# Altium project Sound_Sensor.PrjPcb (part 1 of 4)
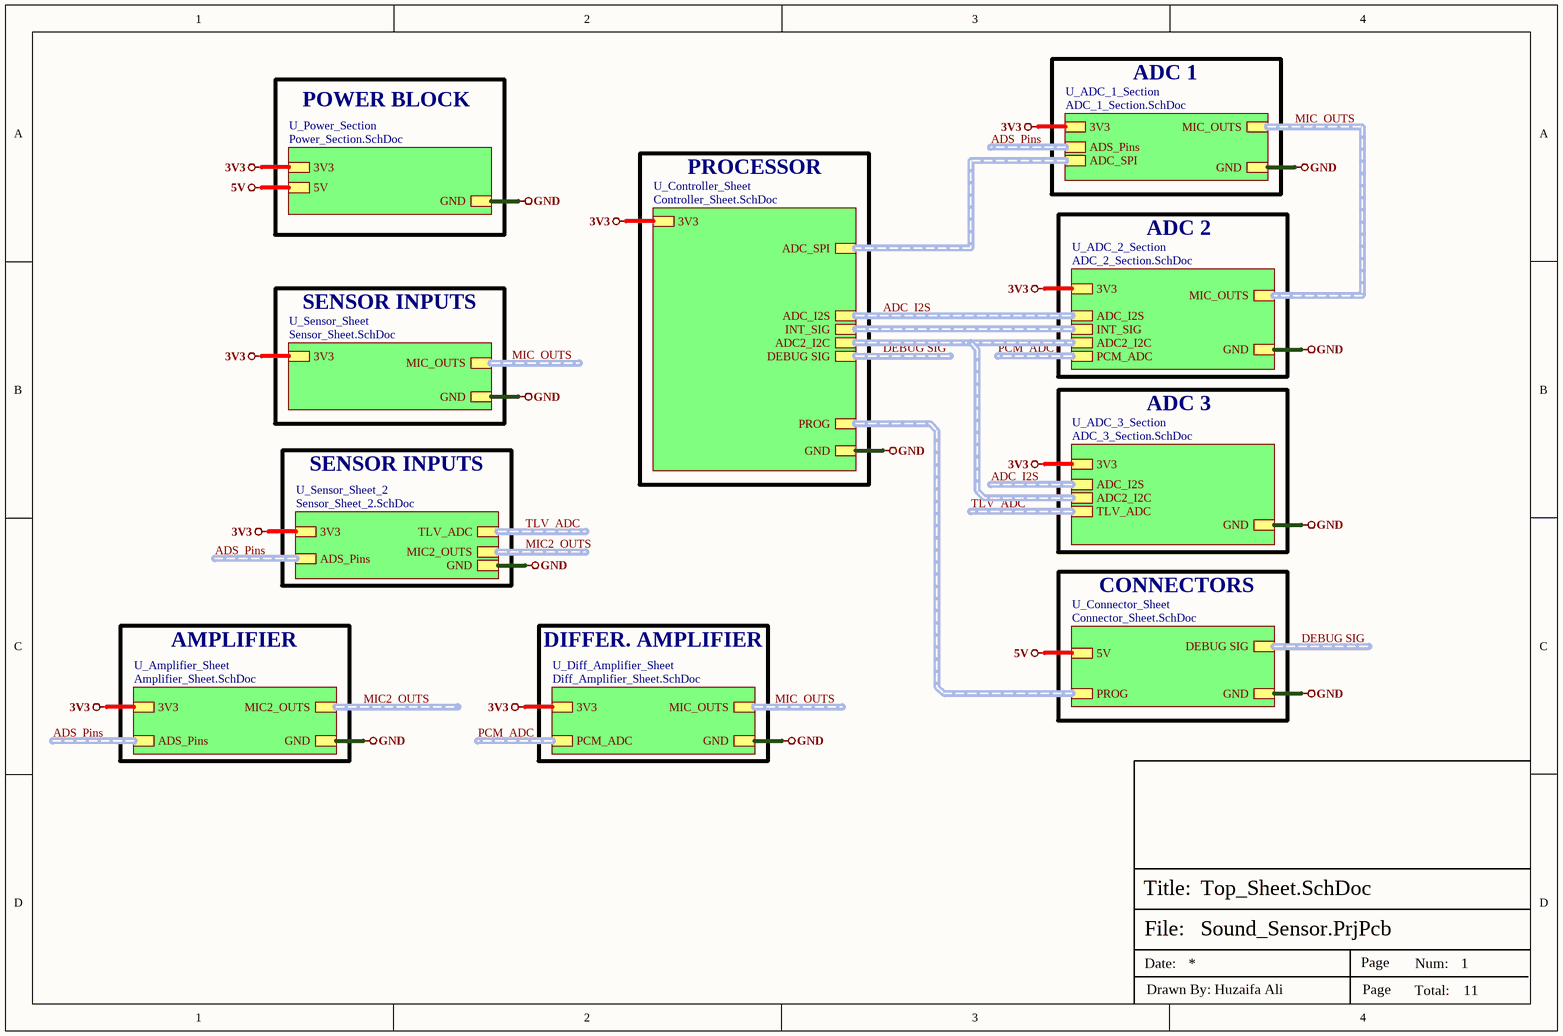
[diagram p0: Top_Sheet.SchDoc]
11 sheets, 369 parts. Net scope: hierarchical (ports join the sheet entries above them; power ports are global).
Board file: Sound_Sensor.PcbDoc
Sheets:
  Top_Sheet.SchDoc
    U_Sensor_Sheet = Sensor_Sheet.SchDoc
    U_Power_Section = Power_Section.SchDoc
    U_Controller_Sheet = Controller_Sheet.SchDoc
    U_Connector_Sheet = Connector_Sheet.SchDoc
    U_ADC_2_Section = ADC_2_Section.SchDoc
    U_ADC_3_Section = ADC_3_Section.SchDoc
    U_ADC_1_Section = ADC_1_Section.SchDoc
    U_Amplifier_Sheet = Amplifier_Sheet.SchDoc
    U_Sensor_Sheet_2 = Sensor_Sheet_2.SchDoc
    U_Diff_Amplifier_Sheet = Diff_Amplifier_Sheet.SchDoc

## Sheet Top_Sheet.SchDoc
size A4; DocumentNumber: 1; SheetNumber: 1; SheetTotal: 11

### Sub-sheets
U_ADC_1_Section = ADC_1_Section.SchDoc: MIC_OUTS (harness MIC_OUTS), ADC_SPI (harness ADC_SPI), 3V3, GND, ADS_Pins (harness ADS_Pins)
U_ADC_2_Section = ADC_2_Section.SchDoc: MIC_OUTS (harness MIC_OUTS), ADC_I2S (harness ADC_I2S), INT_SIG (harness INT_SIG), 3V3, GND, ADC2_I2C (harness ADC2_I2C), PCM_ADC (harness PCM_ADC)
U_ADC_3_Section = ADC_3_Section.SchDoc: 3V3, GND, ADC2_I2C (harness ADC2_I2C), ADC_I2S (harness ADC_I2S), TLV_ADC (harness TLV_ADC)
U_Amplifier_Sheet = Amplifier_Sheet.SchDoc: MIC2_OUTS (harness MIC2_OUTS), 3V3, GND, ADS_Pins (harness ADS_Pins)
U_Connector_Sheet = Connector_Sheet.SchDoc: PROG (harness PROG), GND, 5V, DEBUG SIG (harness DEBUG SIG)
U_Controller_Sheet = Controller_Sheet.SchDoc: PROG (harness PROG), ADC_SPI (harness ADC_SPI), INT_SIG (harness INT_SIG), ADC2_I2C (harness ADC2_I2C), 3V3, GND, ADC_I2S (harness ADC_I2S), DEBUG SIG (harness DEBUG SIG)
U_Diff_Amplifier_Sheet = Diff_Amplifier_Sheet.SchDoc: 3V3, GND, MIC_OUTS (harness MIC_OUTS), PCM_ADC (harness PCM_ADC)
U_Power_Section = Power_Section.SchDoc: 3V3, GND, 5V
U_Sensor_Sheet = Sensor_Sheet.SchDoc: MIC_OUTS (harness MIC_OUTS), 3V3, GND
U_Sensor_Sheet_2 = Sensor_Sheet_2.SchDoc: 3V3, GND, ADS_Pins (harness ADS_Pins), TLV_ADC (harness TLV_ADC), MIC2_OUTS (harness MIC2_OUTS)

### Nets
3V3: sheet U_Sensor_Sheet/3V3, sheet U_Power_Section/3V3, sheet U_Controller_Sheet/3V3, sheet U_ADC_2_Section/3V3, sheet U_ADC_3_Section/3V3, sheet U_ADC_1_Section/3V3, sheet U_Amplifier_Sheet/3V3, sheet U_Sensor_Sheet_2/3V3, sheet U_Diff_Amplifier_Sheet/3V3
5V: sheet U_Power_Section/5V, sheet U_Connector_Sheet/5V
GND: sheet U_Sensor_Sheet/GND, sheet U_Power_Section/GND, sheet U_Controller_Sheet/GND, sheet U_Connector_Sheet/GND, sheet U_ADC_2_Section/GND, sheet U_ADC_3_Section/GND, sheet U_ADC_1_Section/GND, sheet U_Amplifier_Sheet/GND, sheet U_Sensor_Sheet_2/GND, sheet U_Diff_Amplifier_Sheet/GND

### Buses and harness runs
harness ADC_I2S = sheet U_ADC_2_Section/ADC_I2S = sheet U_Controller_Sheet/ADC_I2S
harness ADC_I2S = sheet U_ADC_3_Section/ADC_I2S
harness ADS_Pins = sheet U_ADC_1_Section/ADS_Pins
harness ADS_Pins = sheet U_Amplifier_Sheet/ADS_Pins
harness ADS_Pins = sheet U_Sensor_Sheet_2/ADS_Pins
harness DEBUG SIG = sheet U_Connector_Sheet/DEBUG SIG
harness DEBUG SIG = sheet U_Controller_Sheet/DEBUG SIG
harness MIC2_OUTS = sheet U_Amplifier_Sheet/MIC2_OUTS
harness MIC2_OUTS = sheet U_Sensor_Sheet_2/MIC2_OUTS
harness MIC_OUTS = sheet U_ADC_1_Section/MIC_OUTS = sheet U_ADC_2_Section/MIC_OUTS
harness MIC_OUTS = sheet U_Diff_Amplifier_Sheet/MIC_OUTS
harness MIC_OUTS = sheet U_Sensor_Sheet/MIC_OUTS
harness PCM_ADC = sheet U_ADC_2_Section/PCM_ADC
harness PCM_ADC = sheet U_Diff_Amplifier_Sheet/PCM_ADC
harness sheet U_ADC_1_Section/ADC_SPI = sheet U_Controller_Sheet/ADC_SPI
harness sheet U_ADC_2_Section/ADC2_I2C = sheet U_ADC_3_Section/ADC2_I2C = sheet U_Controller_Sheet/ADC2_I2C
harness sheet U_ADC_2_Section/INT_SIG = sheet U_Controller_Sheet/INT_SIG
harness sheet U_Connector_Sheet/PROG = sheet U_Controller_Sheet/PROG
harness TLV_ADC = sheet U_ADC_3_Section/TLV_ADC
harness TLV_ADC = sheet U_Sensor_Sheet_2/TLV_ADC

### Notes on the sheet
- POWER BLOCK
- ADC 1
- PROCESSOR
- ADC 2
- SENSOR INPUTS
- ADC 3
- AMPLIFIER
- DIFFER. AMPLIFIER
- CONNECTORS
- File:
- Title:
- Date:
- Page
- Num:
- Total:
- Drawn By: Huzaifa Ali

## Sheet Sensor_Sheet.SchDoc
size A4; DocumentNumber: 3; SheetNumber: 3; SheetTotal: 11
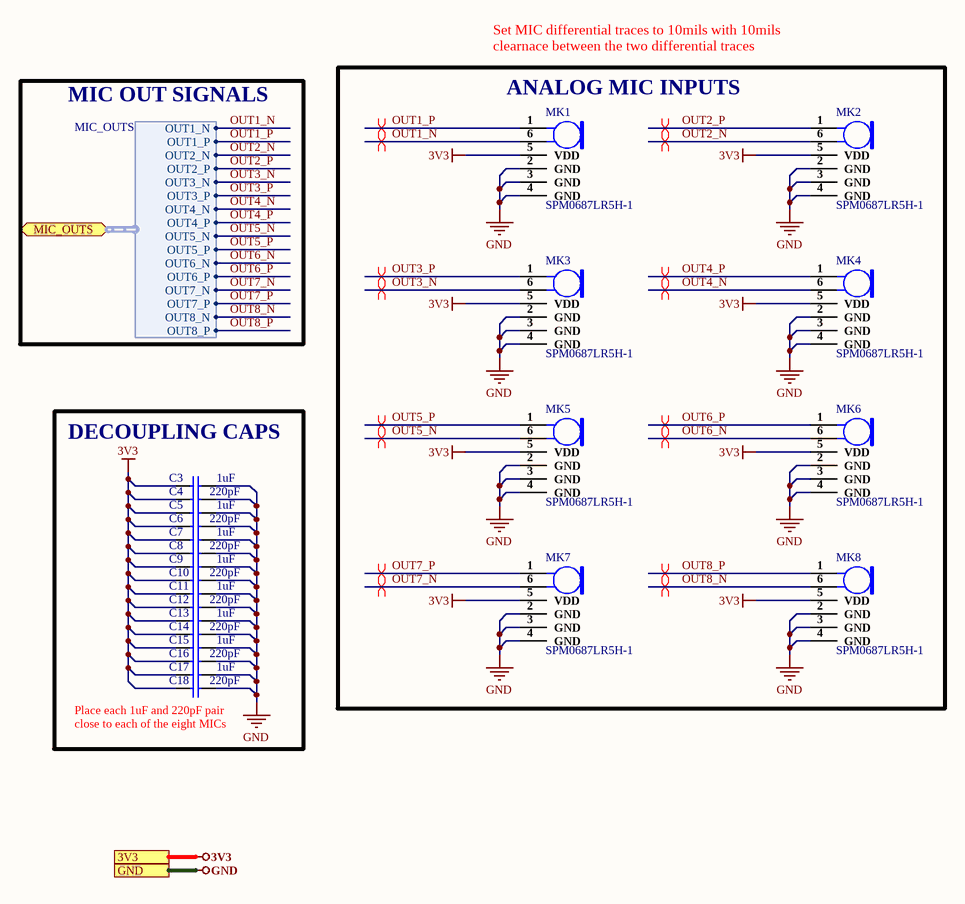
[diagram p1: Sensor_Sheet.SchDoc]

### Parts
C3  1uF  [Cap-0402]
C4  220pF  [Cap 0402]
C5  1uF  [Cap-0402]
C6  220pF  [Cap 0402]
C7  1uF  [Cap-0402]
C8  220pF  [Cap 0402]
C9  1uF  [Cap-0402]
C10  220pF  [Cap 0402]
C11  1uF  [Cap-0402]
C12  220pF  [Cap 0402]
C13  1uF  [Cap-0402]
C14  220pF  [Cap 0402]
C15  1uF  [Cap-0402]
C16  220pF  [Cap 0402]
C17  1uF  [Cap-0402]
C18  220pF  [Cap 0402]
MK1  SPM0687LR5H-1  [SPM0687LR5H-1]
MK2  SPM0687LR5H-1  [SPM0687LR5H-1]
MK3  SPM0687LR5H-1  [SPM0687LR5H-1]
MK4  SPM0687LR5H-1  [SPM0687LR5H-1]
MK5  SPM0687LR5H-1  [SPM0687LR5H-1]
MK6  SPM0687LR5H-1  [SPM0687LR5H-1]
MK7  SPM0687LR5H-1  [SPM0687LR5H-1]
MK8  SPM0687LR5H-1  [SPM0687LR5H-1]

### Blocks framed on the sheet
ANALOG MIC INPUTS: MK1-MK8
DECOUPLING CAPS: C3-C18

### Ports
3V3, GND, MIC_OUTS (bidir, harness MIC_OUTS)

### Harnesses
MIC_OUTS: OUT1_N, OUT1_P, OUT2_N, OUT2_P, OUT3_N, OUT3_P, OUT4_N, OUT4_P, OUT5_N, OUT5_P, OUT6_N, OUT6_P, OUT7_N, OUT7_P, OUT8_N, OUT8_P

### Nets
3V3: C3.1 C4.1 C5.1 C6.1 C7.1 C8.1 C9.1 C10.1 C11.1 C12.1 C13.1 C14.1 C15.1 C16.1 C17.1 C18.1 MK1.5(VDD) MK2.5(VDD) MK3.5(VDD) MK4.5(VDD) MK5.5(VDD) MK6.5(VDD) MK7.5(VDD) MK8.5(VDD) ; port 3V3
GND: C3.2 C4.2 C5.2 C6.2 C7.2 C8.2 C9.2 C10.2 C11.2 C12.2 C13.2 C14.2 C15.2 C16.2 C17.2 C18.2 MK1.2(GND) MK1.3(GND) MK1.4(GND) MK2.2(GND) MK2.3(GND) MK2.4(GND) MK3.2(GND) MK3.3(GND) MK3.4(GND) MK4.2(GND) MK4.3(GND) MK4.4(GND) MK5.2(GND) MK5.3(GND) MK5.4(GND) MK6.2(GND) MK6.3(GND) MK6.4(GND) MK7.2(GND) MK7.3(GND) MK7.4(GND) MK8.2(GND) MK8.3(GND) MK8.4(GND) ; port GND
OUT1_N: MK1.6(OUT-) ; port MIC_OUTS.OUT1_N  [project net MIC_OUTS.OUT1_N]
OUT1_P: MK1.1(OUT+) ; port MIC_OUTS.OUT1_P  [project net MIC_OUTS.OUT1_P]
OUT2_N: MK2.6(OUT-) ; port MIC_OUTS.OUT2_N  [project net MIC_OUTS.OUT2_N]
OUT2_P: MK2.1(OUT+) ; port MIC_OUTS.OUT2_P  [project net MIC_OUTS.OUT2_P]
OUT3_N: MK3.6(OUT-) ; port MIC_OUTS.OUT3_N  [project net MIC_OUTS.OUT3_N]
OUT3_P: MK3.1(OUT+) ; port MIC_OUTS.OUT3_P  [project net MIC_OUTS.OUT3_P]
OUT4_N: MK4.6(OUT-) ; port MIC_OUTS.OUT4_N  [project net MIC_OUTS.OUT4_N]
OUT4_P: MK4.1(OUT+) ; port MIC_OUTS.OUT4_P  [project net MIC_OUTS.OUT4_P]
OUT5_N: MK5.6(OUT-) ; port MIC_OUTS.OUT5_N  [project net MIC_OUTS.OUT5_N]
OUT5_P: MK5.1(OUT+) ; port MIC_OUTS.OUT5_P  [project net MIC_OUTS.OUT5_P]
OUT6_N: MK6.6(OUT-) ; port MIC_OUTS.OUT6_N  [project net MIC_OUTS.OUT6_N]
OUT6_P: MK6.1(OUT+) ; port MIC_OUTS.OUT6_P  [project net MIC_OUTS.OUT6_P]
OUT7_N: MK7.6(OUT-) ; port MIC_OUTS.OUT7_N  [project net MIC_OUTS.OUT7_N]
OUT7_P: MK7.1(OUT+) ; port MIC_OUTS.OUT7_P  [project net MIC_OUTS.OUT7_P]
OUT8_N: MK8.6(OUT-) ; port MIC_OUTS.OUT8_N  [project net MIC_OUTS.OUT8_N]
OUT8_P: MK8.1(OUT+) ; port MIC_OUTS.OUT8_P  [project net MIC_OUTS.OUT8_P]

### Layout directives
differential pair; net class OUT1; differential pair class OUT1_Lines: MIC_OUTS.OUT1_N, MIC_OUTS.OUT1_P
differential pair; net class OUT3; differential pair class OUT3_Lines: MIC_OUTS.OUT3_N, MIC_OUTS.OUT3_P
differential pair; net class OUT5; differential pair class OUT5_Lines: MIC_OUTS.OUT5_N, MIC_OUTS.OUT5_P
differential pair; net class OUT7; differential pair class OUT7_Lines: MIC_OUTS.OUT7_N, MIC_OUTS.OUT7_P
differential pair; net class OUT8; differential pair class OUT8_Lines: MIC_OUTS.OUT8_N, MIC_OUTS.OUT8_P
differential pair; net class OUT6; differential pair class OUT6_Lines: MIC_OUTS.OUT6_N, MIC_OUTS.OUT6_P
differential pair; net class OUT4; differential pair class OUT4_Lines: MIC_OUTS.OUT4_N, MIC_OUTS.OUT4_P
differential pair; net class OUT2; differential pair class OUT2_Lines: MIC_OUTS.OUT2_N, MIC_OUTS.OUT2_P

### Notes on the sheet
- Set MIC differential traces to 10mils with 10mils clearnace between the two differential traces
- MIC OUT SIGNALS
- (near C18) Place each 1uF and 220pF pair close to each of the eight MICs
- File:
- Title:
- Date:
- Page
- Num:
- Total:
- Drawn By: Huzaifa Ali

### Library data of the parts
C3 C5 C7 C9 C11 C13 C15 C17 = CC0402KRX5R8BB105: CAP CER 1UF 25V X5R 0402; Manufacturer: Yageo; Tolerance: 10%; Supplier 1: Mouser; Manufacturer Part Number: CC0402KRX5R8BB105; RoHS: Yes; Category: Ceramic Capacitors; Stock 1: 91975; Pricing 1: 1=0.30000, 10=0.20400, 50=0.20400, 100=0.11600, 1000=0.07200, 10000=0.05900 (USD); Mount: Surface Mount; Case/Package: 0402; Case Code (Metric): 1005; Case Code (Imperial): 0402; Weight: 2.3E-05oz; Min Operating Temperature: -55°C; Max Operating Temperature: 85°C; Packaging: Tape and Reel; Capacitance: 1uF; Voltage Rating: 25V; Dielectric: X5R; Termination: SMD/SMT; Voltage Rating (DC): 25V; Package Quantity: 10000; Length: 0.039inch; Width: 0.02inch; Thickness: 0.022inch; Lead Free: Lead Free; Halogen Free: Halogen Free; RoHS Compliant: Yes; ComponentLink1URL: http://www.mouser.com/ds/2/447/Yageo_UPY-GP_NP0_16V-to-50V_9-358835.pdf?src-supplier=Mouser; ComponentLink1Description: http://www.mouser.com/ds/2/447/Yageo_UPY-GP_NP0_16V-to-50V_9-358835.pdf?src-supplier=Mouser; ComponentLink2URL: http://www.yageo.com/documents/recent/UPY-GPHC_X5R_4V-to-50V_25.pdf?src-supplier=Digi-Key; ComponentLink2Description: http://www.yageo.com/documents/recent/UPY-GPHC_X5R_4V-to-50V_25.pdf?src-supplier=Digi-Key; ComponentLink3URL: https://4donline.ihs.com/images/VipMasterIC/IC/YAGO/YAGO-S-A0006851646/YAGO-S-A0006851646-1.pdf?hkey=6D3A4C79FDBF58556ACFDE234799DDF0&src-supplier=Newark; ComponentLink3Description: https://4donline.ihs.com/images/VipMasterIC/IC/YAGO/YAGO-S-A0006851646/YAGO-S-A0006851646-1.pdf?hkey=6D3A4C79FDBF58556ACFDE234799DDF0&src-supplier=Newark; Supplier Part Number 1: 603-CC402KRX5R8BB105; LCSC Part Number: C326568
C4 C6 C8 C10 C12 C14 C16 C18 = CC0402JRNPO9BN221: CAP CER 220PF 50V C0G/NPO 0402; Manufacturer: Yageo; Dielectric Material: Ceramic; Tolerance: 10%; Dielectric: C0G; Temperature Coefficient: 30ppm/°C; Insulation Resistance: 10GR; Dissipation Factor: 0.1%; Supplier 1: RSComponents; Manufacturer Part Number: CC0402JRNPO9BN221; RoHS: Yes; Category: Ceramic Capacitors; Stock 1: 20000; Pricing 1: 10000=0.00600, 100000=0.00600 (GBP); Mount: Surface Mount; Case/Package: 0402; Number of Pins: 2; Case Code (Metric): 1005; Case Code (Imperial): 0402; Min Operating Temperature: -55°C; Max Operating Temperature: 125°C; Capacitance: 220pF; Package Quantity: 1; Voltage Rating: 50V; Packaging: Tape and Reel; Termination: SMD/SMT; Voltage: 50V; Series: CC; Length: 1mm; Width: 0.02inch; Height: 0.5mm; Thickness: 0.022inch; Depth: 0.5mm; Radiation Hardening: No; RoHS Compliant: Yes; REACH SVHC: No SVHC; Lead Free: Lead Free; ComponentLink1URL: https://datasheet.ciiva.com/11786/0900766b8079c870-11786154.pdf?src-supplier=RSComponents; ComponentLink1Description: https://datasheet.ciiva.com/11786/0900766b8079c870-11786154.pdf?src-supplier=RSComponents; ComponentLink2URL: https://datasheet.ciiva.com/7656/1132289-7656616.pdf?src-supplier=Element14; ComponentLink2Description: https://datasheet.ciiva.com/7656/1132289-7656616.pdf?src-supplier=Element14; ComponentLink3URL: https://datasheet.ciiva.com/8033/1443161-8033609.pdf?src-supplier=Element14; ComponentLink3Description: https://datasheet.ciiva.com/8033/1443161-8033609.pdf?src-supplier=Element14; ComponentLink4URL: https://datasheet.ciiva.com/8033/1443161-8033608.pdf?src-supplier=Element14; ComponentLink4Description: https://datasheet.ciiva.com/8033/1443161-8033608.pdf?src-supplier=Element14; ComponentLink5URL: https://datasheet.ciiva.com/176/mlccorderingcode-176384.pdf?src-supplier=Digi-Key; ComponentLink5Description: https://datasheet.ciiva.com/176/mlccorderingcode-176384.pdf?src-supplier=Digi-Key; ComponentLink6URL: https://datasheet.ciiva.com/176/mlccorderingcode-176383.pdf?src-supplier=Digi-Key; ComponentLink6Description: https://datasheet.ciiva.com/176/mlccorderingcode-176383.pdf?src-supplier=Digi-Key; ComponentLink7URL: https://datasheet.ciiva.com/176/mlccorderingcode-176385.pdf?src-supplier=Digi-Key; ComponentLink7Description: https://datasheet.ciiva.com/176/mlccorderingcode-176385.pdf?src-supplier=Digi-Key; ComponentLink8URL: https://datasheet.ciiva.com/17434/upy-gp-np0-16v-to-50v-8-17434343.pdf?src-supplier=Avnet+Europe; ComponentLink8Description: https://datasheet.ciiva.com/17434/upy-gp-np0-16v-to-50v-8-17434343.pdf?src-supplier=Avnet+Europe; Supplier Part Number 1: 6169284
MK1-MK8 = SPM0687LR5H-1: WINFREY MIC HI SNR/AOP BOT PORT; Manufacturer: Knowles; Shape: Rectangular; Output Type: Analog; Operating Supply Current: 285uA; Item Type: Microphone; Supplier 1: Digi-Key; Manufacturer Part Number: SPM0687LR5H-1; RoHS: Yes; Category: Microphones; Stock 1: 116440; Pricing 1: 1=2.12000, 10=1.75900, 25=1.62560, 50=1.52880, 100=1.43540, 500=1.23212, 1000=1.17611 (USD); Packaging: Cut Tape; Termination: Solder; ComponentLink1URL: https://media.digikey.com/pdf/Data%20Sheets/Knowles%20Acoustics%20PDFs/SPM0687LR5H-1.pdf?src-supplier=Digi-Key; ComponentLink1Description: https://media.digikey.com/pdf/Data%20Sheets/Knowles%20Acoustics%20PDFs/SPM0687LR5H-1.pdf?src-supplier=Digi-Key; Supplier Part Number 1: 423-SPM0687LR5H-1CT-ND; LCSC Part Number: *

## Sheet Power_Section.SchDoc
size A4; DocumentNumber: 2; SheetNumber: 2; SheetTotal: 11
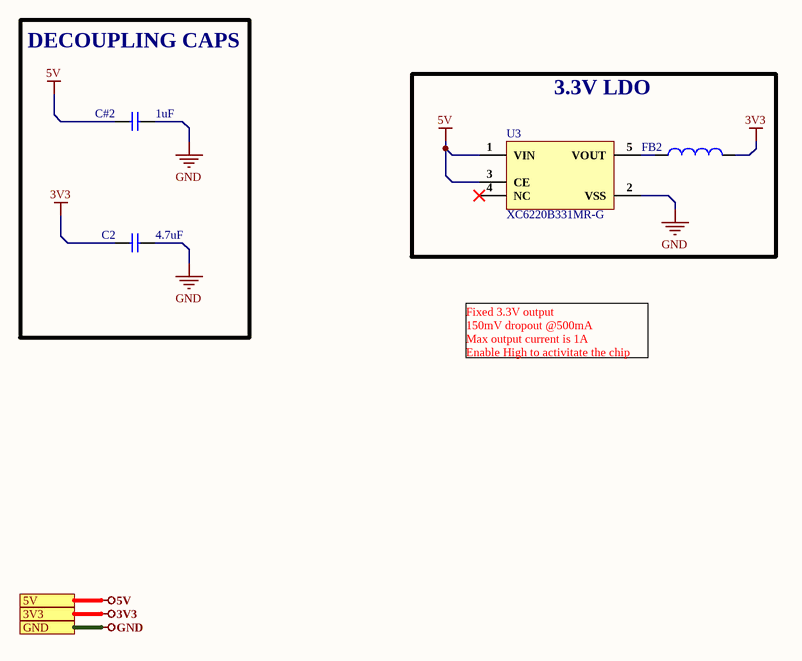
[diagram p2: Power_Section.SchDoc]

### Parts
C2  4.7uF  [Cap-0603]
C#2  1uF  [Cap-0402]
FB2  BLM18SG121TN1D  [IND-0603 (1608 Metric)]  (value not drawn)
U3  XC6220B331MR-G  [SOT-25]

### Blocks framed on the sheet
DECOUPLING CAPS: C2 C#2
3.3V LDO: FB2 U3

### Ports
3V3, 5V, GND

### Nets
3V3: C2.1 FB2.2 ; port 3V3
5V: C#2.1 U3.1(VIN) U3.3(CE) ; port 5V
GND: C2.2 C#2.2 U3.2(VSS) ; port GND
NetFB2_1: FB2.1 U3.5(VOUT)

Not connected (* = marked no-connect by the designer): U3 4(NC)*

### Notes on the sheet
- Fixed 3.3V output
  150mV dropout @500mA
  Max output current is 1A
  Enable High to activitate the chip
- File:
- Title:
- Date:
- Page
- Num:
- Total:
- Drawn By: Huzaifa Ali

### Library data of the parts
C2 = CC0603KRX5R7BB475: CAP CER 4.7UF 16V X5R 0603; Manufacturer: Yageo; Tolerance: 10%; Supplier 1: Digi-Key; Manufacturer Part Number: CC0603KRX5R7BB475; RoHS: Yes; Category: Ceramic Capacitors; Stock 1: 547703; Pricing 1: 1=0.20000, 10=0.13800, 50=0.08280, 100=0.06990, 500=0.04784, 1000=0.04233 (USD); Mount: Surface Mount; Case/Package: 0603; Case Code (Imperial): 0603; Case Code (Metric): 1608; Weight: 7.1E-05oz; Min Operating Temperature: -55°C; Max Operating Temperature: 85°C; Capacitance: 4.7uF; Voltage Rating: 16V; Voltage Rating (DC): 16V; Packaging: Tape and Reel; Dielectric: X5R; Termination: SMD/SMT; Resistor Type: Ceramic; Series: CC; Length: 1.6mm; Width: 0.8mm; Height: 0.8mm; Thickness: 0.037inch; Depth: 0.8mm; Lead Free: Lead Free; Halogen Free: Halogen Free; RoHS Compliant: Yes; ComponentLink1URL: http://www.mouser.com/ds/2/447/UPY-GPHC_X5R_4V-to-50V_25-1131599.pdf?src-supplier=Mouser; ComponentLink1Description: http://www.mouser.com/ds/2/447/UPY-GPHC_X5R_4V-to-50V_25-1131599.pdf?src-supplier=Mouser; ComponentLink2URL: http://www.yageo.com/documents/recent/UPY-GPHC_X5R_4V-to-50V_25.pdf?src-supplier=Digi-Key; ComponentLink2Description: http://www.yageo.com/documents/recent/UPY-GPHC_X5R_4V-to-50V_25.pdf?src-supplier=Digi-Key; Supplier Part Number 1: 311-1785-1-ND; LCSC Part Number: C277476
C#2 = CC0402KRX5R8BB105: as C3 on sheet Sensor_Sheet; Supplier 1: Mouser; Manufacturer Part Number: CC0402KRX5R8BB105; RoHS: Yes; Category: Ceramic Capacitors; Stock 1: 91975; Pricing 1: 1=0.30000, 10=0.20400, 50=0.20400, 100=0.11600, 1000=0.07200, 10000=0.05900 (USD); Mount: Surface Mount; Case/Package: 0402; Case Code (Metric): 1005; Case Code (Imperial): 0402; Weight: 2.3E-05oz; Min Operating Temperature: -55°C; Max Operating Temperature: 85°C; Packaging: Tape and Reel; Capacitance: 1uF; Voltage Rating: 25V; Dielectric: X5R; Termination: SMD/SMT; Voltage Rating (DC): 25V; Package Quantity: 10000; Length: 0.039inch; Width: 0.02inch; Thickness: 0.022inch; Lead Free: Lead Free; Halogen Free: Halogen Free; RoHS Compliant: Yes; ComponentLink1URL: http://www.mouser.com/ds/2/447/Yageo_UPY-GP_NP0_16V-to-50V_9-358835.pdf?src-supplier=Mouser; ComponentLink1Description: http://www.mouser.com/ds/2/447/Yageo_UPY-GP_NP0_16V-to-50V_9-358835.pdf?src-supplier=Mouser; ComponentLink2URL: http://www.yageo.com/documents/recent/UPY-GPHC_X5R_4V-to-50V_25.pdf?src-supplier=Digi-Key; ComponentLink2Description: http://www.yageo.com/documents/recent/UPY-GPHC_X5R_4V-to-50V_25.pdf?src-supplier=Digi-Key; ComponentLink3URL: https://4donline.ihs.com/images/VipMasterIC/IC/YAGO/YAGO-S-A0006851646/YAGO-S-A0006851646-1.pdf?hkey=6D3A4C79FDBF58556ACFDE234799DDF0&src-supplier=Newark; ComponentLink3Description: https://4donline.ihs.com/images/VipMasterIC/IC/YAGO/YAGO-S-A0006851646/YAGO-S-A0006851646-1.pdf?hkey=6D3A4C79FDBF58556ACFDE234799DDF0&src-supplier=Newark; Supplier Part Number 1: 603-CC402KRX5R8BB105; LCSC Part Number: C326568
FB2 = BLM18SG121TN1D: FERRITE BEAD 120 OHM 0603 1LN; Manufacturer: Murata; Material: Steel,Ferrite; Tolerance: 25%; Impedance: 120R; DC Resistance (DCR): 25mR; Max DC Current: 3A; Number of Lines: 1; Test Frequency: 100MHz; Shielding: Unshielded; Supplier 1: Arrow Electronics; Manufacturer Part Number: BLM18SG121TN1D; RoHS: Yes; Category: Ferrite Beads and Chips; Stock 1: 82612; Pricing 1: 1=0.12640, 10=0.08350, 25=0.07210, 100=0.05150, 250=0.04730, 500=0.04110, 1000=0.03420, 3000=0.03360, 6000=0.03320, 15000=0.03270, 30000=0.03200, 75000=0.03150 (USD); Case/Package: 0603; Number of Pins: 2; Core Material: Ferrite; Case Code (Metric): 1608; Case Code (Imperial): 0603; Min Operating Temperature: -55°C; Max Operating Temperature: 125°C; Package Quantity: 1; Max Current Rating: 3A; Packaging: Tape and Reel; Current Rating: 3A; Termination: SMD/SMT; Frequency: 100MHz; Number of Circuits: 1; Series: BLM18S; DC Resistance-Max: 25mR; Length: 1.6mm; Width: 0.8mm; Height: 0.8mm; Depth: 0.8mm; Reach SVHC Compliant: Yes; Lead Free: Lead Free; RoHS Compliant: Yes; ComponentLink1URL: https://datasheet.ciiva.com/1012/l0110s0100blm18s-1012624.pdf?src-supplier=Digi-Key; ComponentLink1Description: https://datasheet.ciiva.com/1012/l0110s0100blm18s-1012624.pdf?src-supplier=Digi-Key; ComponentLink2URL: https://datasheet.ciiva.com/11799/0900766b811b5866-11799181.pdf?src-supplier=RSComponents; ComponentLink2Description: https://datasheet.ciiva.com/11799/0900766b811b5866-11799181.pdf?src-supplier=RSComponents; ComponentLink3URL: https://datasheet.ciiva.com/18093/getdatasheetpartid-295885-18093249.pdf?src-supplier=Verical; ComponentLink3Description: https://datasheet.ciiva.com/18093/getdatasheetpartid-295885-18093249.pdf?src-supplier=Verical; ComponentLink4URL: https://datasheet.ciiva.com/41449/001171723-da-01-en-chip-drossel0603-120r-3000ma-1-6x0-8mm-41449353.pdf?src-supplier=Conrad; ComponentLink4Description: https://datasheet.ciiva.com/41449/001171723-da-01-en-chip-drossel0603-120r-3000ma-1-6x0-8mm-41449353.pdf?src-supplier=Conrad; ComponentLink5URL: https://datasheet.ciiva.com/41449/001172312-da-01-en-drossel-0603-120r-1-6x0-8mm-10000st-41449675.pdf?src-supplier=Conrad; ComponentLink5Description: https://datasheet.ciiva.com/41449/001172312-da-01-en-drossel-0603-120r-1-6x0-8mm-10000st-41449675.pdf?src-supplier=Conrad; ComponentLink6URL: https://datasheet.ciiva.com/8021/5151-8021511.pdf?src-supplier=Element14; ComponentLink6Description: https://datasheet.ciiva.com/8021/5151-8021511.pdf?src-supplier=Element14; ComponentLink7URL: https://datasheet.ciiva.com/8021/5151-8021512.pdf?src-supplier=Element14; ComponentLink7Description: https://datasheet.ciiva.com/8021/5151-8021512.pdf?src-supplier=Element14; ComponentLink8URL: https://datasheet.ciiva.com/14122/blm-series-eng-tds-14122906.pdf?src-supplier=Distrelec; ComponentLink8Description: https://datasheet.ciiva.com/14122/blm-series-eng-tds-14122906.pdf?src-supplier=Distrelec; ComponentLink9URL: https://datasheet.ciiva.com/1012/l0110s0100blm18s-1012623.pdf?src-supplier=Digi-Key; ComponentLink9Description: https://datasheet.ciiva.com/1012/l0110s0100blm18s-1012623.pdf?src-supplier=Digi-Key; ComponentLink10URL: https://datasheet.ciiva.com/1012/l0110s0100blm18s-1012625.pdf?src-supplier=Digi-Key; ComponentLink10Description: https://datasheet.ciiva.com/1012/l0110s0100blm18s-1012625.pdf?src-supplier=Digi-Key; ComponentLink11URL: https://datasheet.ciiva.com/16395/l0110s0100blm18s-16395498.pdf?src-supplier=Future+Electronics; ComponentLink11Description: https://datasheet.ciiva.com/16395/l0110s0100blm18s-16395498.pdf?src-supplier=Future+Electronics; Supplier Part Number 1: BLM18SG121TN1D; LCSC Part Number: C113030; Item Type: Ferrite Bead
U3 = XC6220B331MR-G: Linear Voltage Regulator IC Positive Fixed 1 Output 3.3V 1A SOT-25; Manufacturer: Torex; Dropout Voltage: 655mV; Min Input Voltage: 1.6V; Max Input Voltage: 6V; Number of Regulators: 1; Min Current Limit: 1.005A; Supplier 1: Newark; Manufacturer Part Number: XC6220B331MR-G; RoHS: Yes; Category: Voltage Regulators - Linear; Stock 1: 3078; Pricing 1: 1=1.20000, 10=1.08000, 100=0.83900, 500=0.69300, 1000=0.54800 (USD); Mount: Surface Mount; Case/Package: SOT-25; Number of Pins: 5; Min Operating Temperature: -40°C; Max Operating Temperature: 85°C; Package Quantity: 1; Packaging: Tape and Reel; Output Current: 1A; Output Voltage: 3.3V; Nominal Output Voltage: 3.3V; Output Type: Fixed; Series: -; REACH SVHC: No SVHC; RoHS Compliant: Yes; ComponentLink1URL: https://datasheet.ciiva.com/7992/610888-7992813.pdf?src-supplier=Element14; ComponentLink1Description: https://datasheet.ciiva.com/7992/610888-7992813.pdf?src-supplier=Element14; ComponentLink2URL: https://datasheet.ciiva.com/5755/610888-5755886.pdf?src-supplier=Farnell; ComponentLink2Description: https://datasheet.ciiva.com/5755/610888-5755886.pdf?src-supplier=Farnell; ComponentLink3URL: https://datasheet.ciiva.com/2040/xc6220-2040201.pdf?src-supplier=Digi-Key; ComponentLink3Description: https://datasheet.ciiva.com/2040/xc6220-2040201.pdf?src-supplier=Digi-Key; ComponentLink4URL: https://datasheet.ciiva.com/2040/xc6220-2040200.pdf?src-supplier=Digi-Key; ComponentLink4Description: https://datasheet.ciiva.com/2040/xc6220-2040200.pdf?src-supplier=Digi-Key; ComponentLink5URL: https://datasheet.ciiva.com/2040/xc6220-2040202.pdf?src-supplier=Digi-Key; ComponentLink5Description: https://datasheet.ciiva.com/2040/xc6220-2040202.pdf?src-supplier=Digi-Key; Supplier Part Number 1: 84R0738

## Sheet Controller_Sheet.SchDoc
size A4; DocumentNumber: 5; SheetNumber: 5; SheetTotal: 11
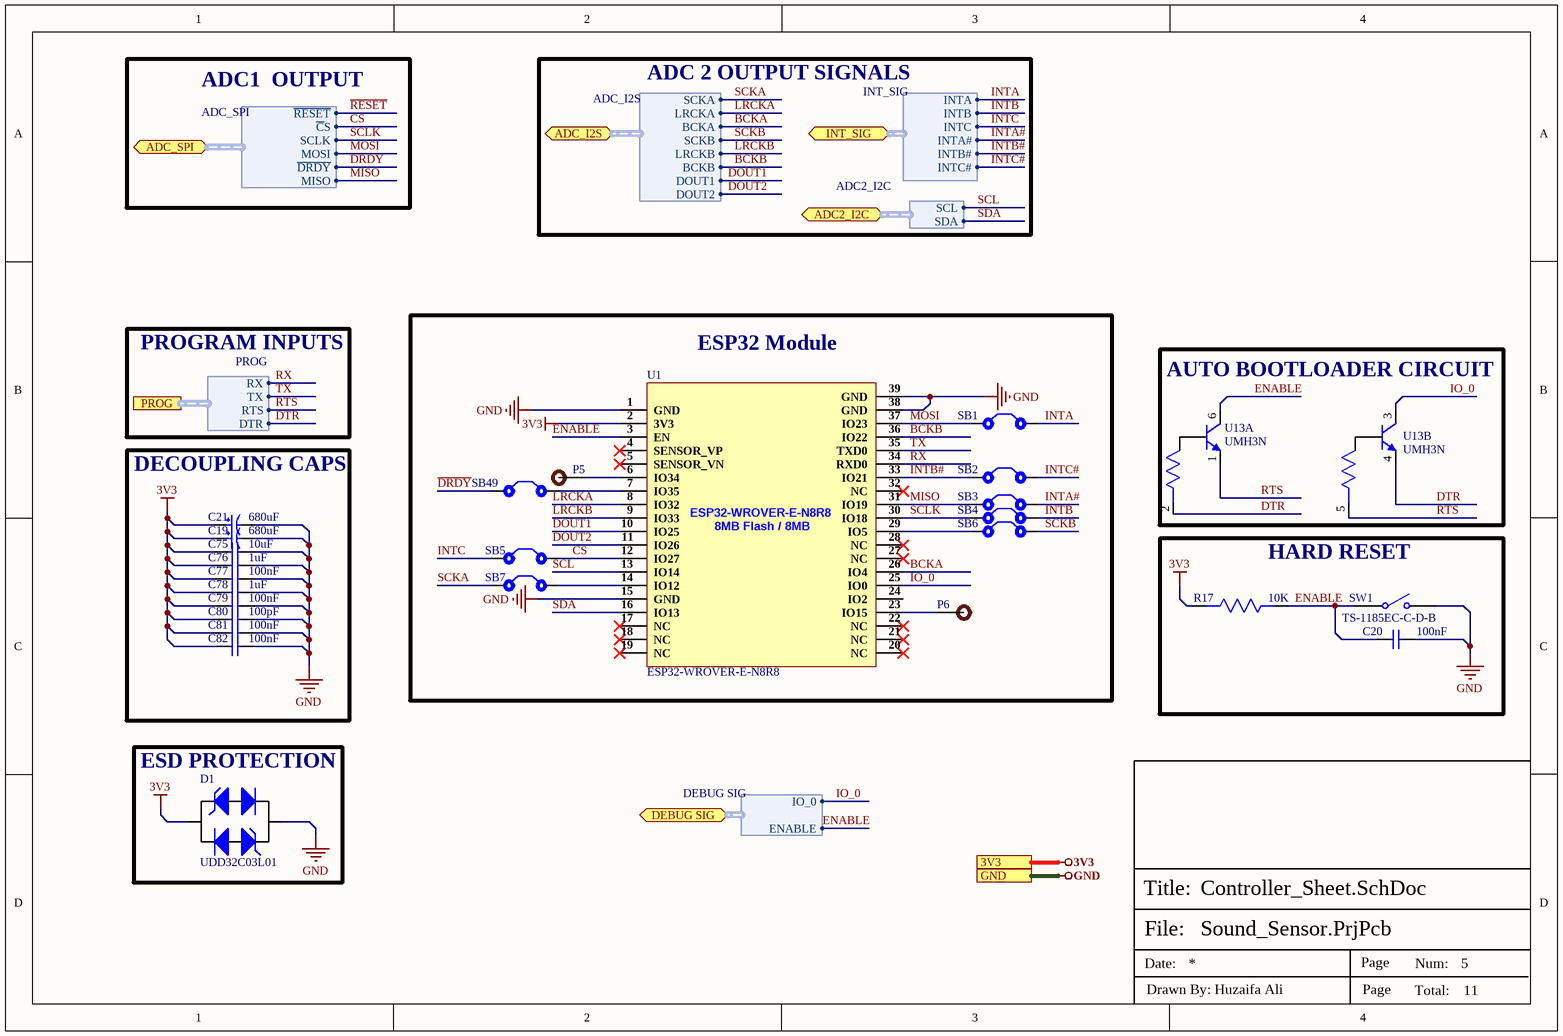
[diagram p3: Controller_Sheet.SchDoc]

### Parts
C19  680uF  [Case-D]
C20  100nF  [Cap-0603]
C21  680uF  [Case-D]
C75  10uF  [Cap-0603]
C76  1uF  [Cap-0402]
C77  100nF  [Cap-0603]
C78  1uF  [Cap-0402]
C79  100nF  [Cap-0603]
C80  100pF  [Cap 0603]
C81  100nF  [Cap-0603]
C82  100nF  [Cap-0603]
D1  UDD32C03L01  [UDD32C03L01]
P5  TEST POINT  [Test-point]  (value not drawn)
P6  TEST POINT  [Test-point]  (value not drawn)
R17  10K  [Res-0402]
SB1  Solder Bridge  [Solder Bridge]  (value not drawn)
SB2  Solder Bridge  [Solder Bridge]  (value not drawn)
SB3  Solder Bridge  [Solder Bridge]  (value not drawn)
SB4  Solder Bridge  [Solder Bridge]  (value not drawn)
SB5  Solder Bridge  [Solder Bridge]  (value not drawn)
SB6  Solder Bridge  [Solder Bridge]  (value not drawn)
SB7  Solder Bridge  [Solder Bridge]  (value not drawn)
SB49  Solder Bridge  [Solder Bridge]  (value not drawn)
SW1  TS-1185EC-C-D-B  [TS-1185EC-C-D-B]
U1  ESP32-WROVER-E-N8R8  [ESP32-WROVER-E-N8R8]
U13  UMH3N  [UMH3N]  (parts A,B of 2)

### Blocks framed on the sheet
ESP32 Module: P5 P6 SB1-SB7 SB49 U1
AUTO BOOTLOADER CIRCUIT: U13
DECOUPLING CAPS: C19 C21 C75-C82
HARD RESET: C20 R17 SW1
ESD PROTECTION: D1

### Ports
3V3, ADC2_I2C (bidir, harness ADC2_I2C), ADC_I2S (bidir, harness ADC_I2S), ADC_SPI (bidir, harness ADC_SPI), DEBUG SIG (bidir, harness DEBUG SIG), GND, INT_SIG (bidir, harness INT_SIG), PROG (harness PROG)

### Harnesses
PROG: RX, TX, RTS, DTR
ADC_SPI: ~{RESET}, ~{C}S, SCLK, MOSI, ~{DRDY}, MISO
INT_SIG: INTA, INTB, INTC, INTA#, INTB#, INTC#
ADC2_I2C: SCL, SDA
ADC_I2S: SCKA, LRCKA, BCKA, SCKB, LRCKB, BCKB, DOUT1, DOUT2
DEBUG SIG: IO_0, ENABLE

### Nets
3V3: C19.1 C21.1 C75.1 C76.1 C77.1 C78.1 C79.1 C80.1 C81.1 C82.1 D1.1 R17.2 U1.2(3V3) ; port 3V3
GND: C19.2 C20.2 C21.2 C75.2 C76.2 C77.2 C78.2 C79.2 C80.2 C81.2 C82.2 D1.2 SW1.2 U1.1(GND) U1.15(GND) U1.38(GND) U1.39(GND) ; port GND
~{C}S: SB5.2 U1.12(IO27) ; port ADC_SPI.~{C}S
~{DRDY}: SB49.1 ; port ADC_SPI.~{DRDY}
BCKA: U1.26(IO4) ; port ADC_I2S.BCKA  [project net ADC_I2S.BCKA]
BCKB: U1.36(IO22) ; port ADC_I2S.BCKB  [project net ADC_I2S.BCKB]
DOUT1: U1.10(IO25) ; port ADC_I2S.DOUT1  [project net ADC_I2S.DOUT1]
DOUT2: U1.11(IO26) ; port ADC_I2S.DOUT2  [project net ADC_I2S.DOUT2]
DTR: U13.2 U13.4(E) ; port PROG.DTR
ENABLE: C20.1 R17.1 SW1.1 U1.3(EN) U13.6(C) ; port DEBUG SIG.ENABLE  [project net DEBUG SIG.ENABLE]
INTA: SB1.2 ; port INT_SIG.INTA
INTA#: SB3.2 ; port INT_SIG.INTA#
INTB: SB4.2 ; port INT_SIG.INTB
INTB#: SB2.1 U1.33(IO21) ; port INT_SIG.INTB#
INTC: SB5.1 ; port INT_SIG.INTC
INTC#: SB2.2 ; port INT_SIG.INTC#
IO_0: U1.25(IO0) U13.3(C) ; port DEBUG SIG.IO_0  [project net DEBUG SIG.IO_0]
LRCKA: U1.8(IO32) ; port ADC_I2S.LRCKA  [project net ADC_I2S.LRCKA]
LRCKB: U1.9(IO33) ; port ADC_I2S.LRCKB  [project net ADC_I2S.LRCKB]
MISO: SB3.1 U1.31(IO19) ; port ADC_SPI.MISO
MOSI: SB1.1 U1.37(IO23) ; port ADC_SPI.MOSI
RTS: U13.1(E) U13.5 ; port PROG.RTS
RX: U1.34(RXD0) ; port PROG.RX
SCKA: SB7.1 ; port ADC_I2S.SCKA  [project net ADC_I2S.SCKA]
SCKB: SB6.2 ; port ADC_I2S.SCKB  [project net ADC_I2S.SCKB]
SCL: U1.13(IO14) ; port ADC2_I2C.SCL
SCLK: SB4.1 U1.30(IO18) ; port ADC_SPI.SCLK
SDA: U1.16(IO13) ; port ADC2_I2C.SDA
TX: U1.35(TXD0) ; port PROG.TX
NetP5_1: P5.1 U1.6(IO34)
NetP6_1: P6.1 U1.23(IO15)
NetSB6_1: SB6.1 U1.29(IO5)
NetSB7_2: SB7.2 U1.14(IO12)
NetSB49_2: SB49.2 U1.7(IO35)

Not connected (* = marked no-connect by the designer): U1 4(SENSOR_VP)* 5(SENSOR_VN)* 17(NC)* 18(NC)* 19(NC)* 20(NC)* 21(NC)* 22(NC)* 24(IO2) 27(NC)* 28(NC)* 32(NC)*

### Notes on the sheet
- ADC1  OUTPUT
- ADC 2 OUTPUT SIGNALS
- PROGRAM INPUTS
- File:
- Title:
- Date:
- Page
- Num:
- Total:
- Drawn By: Huzaifa Ali
- (in symbol ESP32-WROVER-E-N8R8) ESP32-WROVER-E-N8R8 / 8MB Flash / 8MB PSRAM

### Library data of the parts
C19 C21 = 6TPE680MI: CAP TANT POLY 680UF 6.3V 2917; Manufacturer: Panasonic; Tolerance: 20%; ESR (Equivalent Series Resistance): 18mR; Ripple Current: 3.5A; Leakage Current: 428.4uA; Polarity: Polar; Dissipation Factor: 15%; Item Type: Capacitor; Supplier 1: Digi-Key; Manufacturer Part Number: 6TPE680MI; RoHS: Yes; Category: Tantalum Capacitors; Stock 1: 9647; Pricing 1: 1=3.55000, 10=2.86700, 50=2.50240, 100=2.18960, 500=1.66828, 1000=1.45975 (USD); Mount: Surface Mount; Case/Package: 2917; Number of Pins: 4; Case Code (Metric): 7343; Case Code (Imperial): 2917; Min Operating Temperature: -55°C; Max Operating Temperature: 105°C; Packaging: Tape and Reel; Capacitance: 680uF; Package Quantity: 2000; Voltage Rating: 6.3V; Voltage Rating (DC): 6.3V; Termination: SMD/SMT; Voltage: 6.3V; Features: General Purpose; Series: POSCAP™ TPE; Construction: Flat; Length: 7.3mm; Width: 4.3mm; Height: 3.8mm; Height - Seated (Max): 0.157inch; Depth: 4.3mm; Radiation Hardening: No; Reach SVHC Compliant: Yes; Lead Free: Lead Free; RoHS Compliant: Yes; ComponentLink1URL: https://datasheet.ciiva.com/25786/1734363-25786077.pdf?src-supplier=Farnell; ComponentLink1Description: https://datasheet.ciiva.com/25786/1734363-25786077.pdf?src-supplier=Farnell; ComponentLink2URL: https://datasheet.ciiva.com/22745/1734363-22745373.pdf?src-supplier=Element14; ComponentLink2Description: https://datasheet.ciiva.com/22745/1734363-22745373.pdf?src-supplier=Element14; ComponentLink3URL: https://datasheet.ciiva.com/24022/tpe-os-262406-24022136.pdf?src-supplier=Mouser; ComponentLink3Description: https://datasheet.ciiva.com/24022/tpe-os-262406-24022136.pdf?src-supplier=Mouser; ComponentLink4URL: https://datasheet.ciiva.com/26840/getdatasheetpartid-750514-26840938.pdf?src-supplier=Verical; ComponentLink4Description: https://datasheet.ciiva.com/26840/getdatasheetpartid-750514-26840938.pdf?src-supplier=Verical; Supplier Part Number 1: P16633CT-ND; LCSC Part Number: C79115; ComponentLink5Description: New link; ComponentLink5URL: *
C20 C77 C79 C81 C82 = CC0603KRX5R9BB104: CAP CER 0.1UF 50V X5R 0603; Manufacturer: Yageo; Tolerance: 10%; Item Type: Capacitor; Supplier 1: Digi-Key; Manufacturer Part Number: CC0603KRX5R9BB104; RoHS: Yes; Category: Ceramic Capacitors; Stock 1: 152253; Pricing 1: 1=0.10000, 10=0.05200, 50=0.02820, 100=0.02310, 500=0.01648, 1000=0.01294 (USD); Mount: Surface Mount; Case/Package: 0603; Case Code (Imperial): 0603; Case Code (Metric): 1608; Weight: 7.1E-05oz; Min Operating Temperature: -55°C; Max Operating Temperature: 85°C; Capacitance: 100nF; Packaging: Tape and Reel; Voltage Rating: 50V; Dielectric: X5R; Termination: SMD/SMT; Voltage Rating (DC): 50V; Package Quantity: 4000; Length: 0.063inch; Width: 0.031inch; Thickness: 0.035inch; Lead Free: Lead Free; Halogen Free: Halogen Free; ComponentLink1URL: http://www.mouser.com/ds/2/447/Yageo_UPY-GP_NP0_16V-to-50V_9-358835.pdf?src-supplier=Mouser; ComponentLink1Description: http://www.mouser.com/ds/2/447/Yageo_UPY-GP_NP0_16V-to-50V_9-358835.pdf?src-supplier=Mouser; ComponentLink2URL: https://www.yageo.com/upload/media/product/productsearch/datasheet/mlcc/UPY-GPHC_X5R_4V-to-50V_26.pdf?src-supplier=Digi-Key; ComponentLink2Description: https://www.yageo.com/upload/media/product/productsearch/datasheet/mlcc/UPY-GPHC_X5R_4V-to-50V_26.pdf?src-supplier=Digi-Key; ComponentLink3URL: http://www.yageo.com/exep/pages/download/literatures/ProductSelectionGuide%202014_Final_2.pdf?src-supplier=Digi-Key; ComponentLink3Description: http://www.yageo.com/exep/pages/download/literatures/ProductSelectionGuide%202014_Final_2.pdf?src-supplier=Digi-Key; Supplier Part Number 1: 311-4046-1-ND; LCSC Part Number: C110022
C75 = C1608X5R1E106M080AC: CAP CER 10UF 25V X5R 0603; Manufacturer: TDK; Dielectric Material: Ceramic; Tolerance: 20%; Supplier 1: Digi-Key; Manufacturer Part Number: C1608X5R1E106M080AC; Stock 1: 61681; Pricing 1: 1=0.96, 10=0.704, 100=0.483, 500=0.38238, 1000=0.322 (USD); Mount: Surface Mount; Case/Package: 0603; Weight: 7.1E-05oz; Case Code (Imperial): 0603; Case Code (Metric): 1608; Min Operating Temperature: -55°C; Max Operating Temperature: 85°C; Capacitance: 10uF; Packaging: Tape and Reel; Voltage Rating: 25V; Voltage Rating (DC): 25V; Termination: SMD/SMT; Package Quantity: 1; Dielectric: X5R; Composition: Ceramic; Length: 1.6mm; Height: 0.8mm; Width: 0.8mm; Thickness: 0.039inch; Depth: 0.8mm; Lead Free: Lead Free; REACH SVHC: No SVHC; Supplier Part Number 1: 445-9015-1-ND; LCSC Part Number: C2168289
C76 C78 = CC0402KRX5R8BB105: as C3 on sheet Sensor_Sheet; Supplier 1: Mouser; Manufacturer Part Number: CC0402KRX5R8BB105; RoHS: Yes; Category: Ceramic Capacitors; Stock 1: 91975; Pricing 1: 1=0.30000, 10=0.20400, 50=0.20400, 100=0.11600, 1000=0.07200, 10000=0.05900 (USD); Mount: Surface Mount; Case/Package: 0402; Case Code (Metric): 1005; Case Code (Imperial): 0402; Weight: 2.3E-05oz; Min Operating Temperature: -55°C; Max Operating Temperature: 85°C; Packaging: Tape and Reel; Capacitance: 1uF; Voltage Rating: 25V; Dielectric: X5R; Termination: SMD/SMT; Voltage Rating (DC): 25V; Package Quantity: 10000; Length: 0.039inch; Width: 0.02inch; Thickness: 0.022inch; Lead Free: Lead Free; Halogen Free: Halogen Free; RoHS Compliant: Yes; ComponentLink1URL: http://www.mouser.com/ds/2/447/Yageo_UPY-GP_NP0_16V-to-50V_9-358835.pdf?src-supplier=Mouser; ComponentLink1Description: http://www.mouser.com/ds/2/447/Yageo_UPY-GP_NP0_16V-to-50V_9-358835.pdf?src-supplier=Mouser; ComponentLink2URL: http://www.yageo.com/documents/recent/UPY-GPHC_X5R_4V-to-50V_25.pdf?src-supplier=Digi-Key; ComponentLink2Description: http://www.yageo.com/documents/recent/UPY-GPHC_X5R_4V-to-50V_25.pdf?src-supplier=Digi-Key; ComponentLink3URL: https://4donline.ihs.com/images/VipMasterIC/IC/YAGO/YAGO-S-A0006851646/YAGO-S-A0006851646-1.pdf?hkey=6D3A4C79FDBF58556ACFDE234799DDF0&src-supplier=Newark; ComponentLink3Description: https://4donline.ihs.com/images/VipMasterIC/IC/YAGO/YAGO-S-A0006851646/YAGO-S-A0006851646-1.pdf?hkey=6D3A4C79FDBF58556ACFDE234799DDF0&src-supplier=Newark; Supplier Part Number 1: 603-CC402KRX5R8BB105; LCSC Part Number: C326568
C80 = CC0603KRX7R8BB101: CAP CER 100PF 25V X7R 0603; Manufacturer: Yageo; Tolerance: 10%; Supplier 1: Avnet; Manufacturer Part Number: CC0603KRX7R8BB101; RoHS: Yes; Category: Ceramic Capacitors; Stock 1: 12000; Pricing 1: 4000=0.00493, 8000=0.00479, 16000=0.00466, 24000=0.00452, 32000=0.00439 (USD); Mount: Surface Mount; Case/Package: 0603; Case Code (Imperial): 0603; Case Code (Metric): 1608; Weight: 7.1E-05oz; Min Operating Temperature: -55°C; Max Operating Temperature: 125°C; Packaging: Tape and Reel; Capacitance: 100pF; Voltage Rating (DC): 25V; Dielectric: X7R; Voltage Rating: 25V; Termination: SMD/SMT; Resistor Type: Ceramic; Series: CC; Length: 0.063inch; Width: 0.031inch; Thickness: 0.035inch; Depth: 0.8mm; Lead Free: Lead Free; Halogen Free: Halogen Free; RoHS Compliant: Yes; ComponentLink1URL: https://datasheet.ciiva.com/13265/upy-gphc-x7r-6-3v-to-50v-8-12304-13265007.pdf?src-supplier=Mouser; ComponentLink1Description: https://datasheet.ciiva.com/13265/upy-gphc-x7r-6-3v-to-50v-8-12304-13265007.pdf?src-supplier=Mouser; Supplier Part Number 1: CC0603KRX7R8BB101
D1 = UDD32C03L01: 15V 19A 3.3V 4V Bidirectional SOD-323 ESD Protection Devices ROHS; Manufacturer: Brightking; Manufacturer Part No: UDD32C03L01; Package: SOD-323; ComponentLink1Description: LCSC; ComponentLink1URL: https://lcsc.com/product-detail/span-style-background-color-ff0-ESD-span-Protection-Devices_Brightking-Elec-TAIWAN-UDD32C03L01_C78439.html
P5 P6 = TEST POINT: Test Point ON
R17 = RC0402FR-0710KL: RES 10K OHM 1% 1/16W 0402; Manufacturer: Yageo; Resistance: 10kR; Voltage Rating (DC): 50V; Temperature Coefficient: 100ppm/°C; Power Rating: 62.5mW; Max Power Dissipation: 63mW; Supplier 1: Mouser; Manufacturer Part Number: RC0402FR-0710KL; RoHS: Yes; Category: Chip SMD Resistors; Stock 1: 18648329; Pricing 1: 1=0.10000, 10=0.01400, 50=0.01400, 100=0.00500, 1000=0.00300, 10000=0.00200 (USD); Case/Package: 0402; Number of Pins: 2; Case Code (Imperial): 0402; Case Code (Metric): 1005; Min Operating Temperature: -55°C; Max Operating Temperature: 155°C; Resistor Type: Thick Film; Tolerance: 1%; Packaging: Tape and Reel; Voltage Rating: 50V; Termination: SMD/SMT; Working Voltage: 50V; Number of Terminations: 2; Features: Moisture Resistant; Series: RC; Resistance Tolerance: 1%; Construction: Rectangular; Length: 1mm; Width: 0.5mm; Height: 0.32mm; Depth: 0.5mm; Lead Pitch: 0.2mm; REACH SVHC: No SVHC; Lead Free: Lead Free; RoHS Compliant: Yes; Military Standard: Not; ComponentLink1URL: https://datasheet.ciiva.com/7660/38568-7660787.pdf?src-supplier=Element14; ComponentLink1Description: https://datasheet.ciiva.com/7660/38568-7660787.pdf?src-supplier=Element14; ComponentLink2URL: https://datasheet.ciiva.com/7849/1686128-7849814.pdf?src-supplier=Element14; ComponentLink2Description: https://datasheet.ciiva.com/7849/1686128-7849814.pdf?src-supplier=Element14; ComponentLink3URL: https://datasheet.ciiva.com/7983/1018594-7983486.pdf?src-supplier=Element14; ComponentLink3Description: https://datasheet.ciiva.com/7983/1018594-7983486.pdf?src-supplier=Element14; ComponentLink4URL: https://datasheet.ciiva.com/22747/1018594-22747512.pdf?src-supplier=Element14; ComponentLink4Description: https://datasheet.ciiva.com/22747/1018594-22747512.pdf?src-supplier=Element14; ComponentLink5URL: https://datasheet.ciiva.com/12667/pyu-rc0402-51-rohs-l-6-r-12667067.pdf?src-supplier=Mouser; ComponentLink5Description: https://datasheet.ciiva.com/12667/pyu-rc0402-51-rohs-l-6-r-12667067.pdf?src-supplier=Mouser; ComponentLink6URL: https://datasheet.ciiva.com/7849/1784430-7849813.pdf?src-supplier=Element14; ComponentLink6Description: https://datasheet.ciiva.com/7849/1784430-7849813.pdf?src-supplier=Element14; ComponentLink7URL: https://datasheet.ciiva.com/7849/1784430-7849815.pdf?src-supplier=Element14; ComponentLink7Description: https://datasheet.ciiva.com/7849/1784430-7849815.pdf?src-supplier=Element14; Supplier Part Number 1: 603-RC0402FR-0710KL; LCSC Part Number: C60490
SB1-SB7 SB49 = Solder Bridge: Solder Bridge ON
SW1 = TS-1185EC-C-D-B: 3mm 2mm Round Button 50mA Top3.65mm SPST 12V SMD Tactile Switches; Manufacturer: XKB; Manufacturer Part No: TS-1185EC-C-D-B; Package: Custom; ComponentLink1Description: LCSC; ComponentLink1URL: https://lcsc.com/product-detail/Tactile-Switches_XKB-Connectivity-TS-1185EC-C-D-B_C318893.html
U1 = ESP32-WROVER-E-N8R8: RF TXRX MOD WIFI PCB TRACE SMD; Manufacturer: Espressif Systems; Item Type: Module; Supplier 1: Digi-Key; Manufacturer Part Number: ESP32-WROVER-E-N8R8; RoHS: No; Category: Uncategorized; Stock 1: 16752; Pricing 1: 1=3.60000 (USD); Supplier Part Number 1: 1965-ESP32-WROVER-E-N8R8CT-ND; LCSC Part Number: C2973667; ComponentLink1Description: LCSC; ComponentLink1URL: https://www.lcsc.com/product-detail/WiFi-Modules_Espressif-Systems-ESP32-WROVER-E-N8R8_C2973667.html
U13 = UMH3N: 2 NPN pre-biased (Dual) 150mW 100mA 50V SC-70-6(SOT-363) Digital Transistors ROHS; Manufacturer: Changjiang; Manufacturer Part No: UMH3N; Package: SC-70-6(SOT-363); ComponentLink1Description: LCSC; ComponentLink1URL: https://www.lcsc.com/product-detail/Digital-Transistors_Changjiang-Electronics-Tech-CJ-UMH3N_C62892.html